# Altium schematic sheet MLP.SchDoc: Modulated Load Perturbation
size A4; ApprovedBy: LD Stanton; Author: LD Stanton; CompanyName: University of Cape Town; DrawnBy: Lawrence Stanton; Engineer: Lawrence Stanton; Organization: University of Cape Town; Address1: Department of Electrical Engineering; Address2: Rondebosch; Address3: Cape Town; Address4: South Africa 7701; DocumentNumber: 10; SheetNumber: 10; SheetTotal: 14
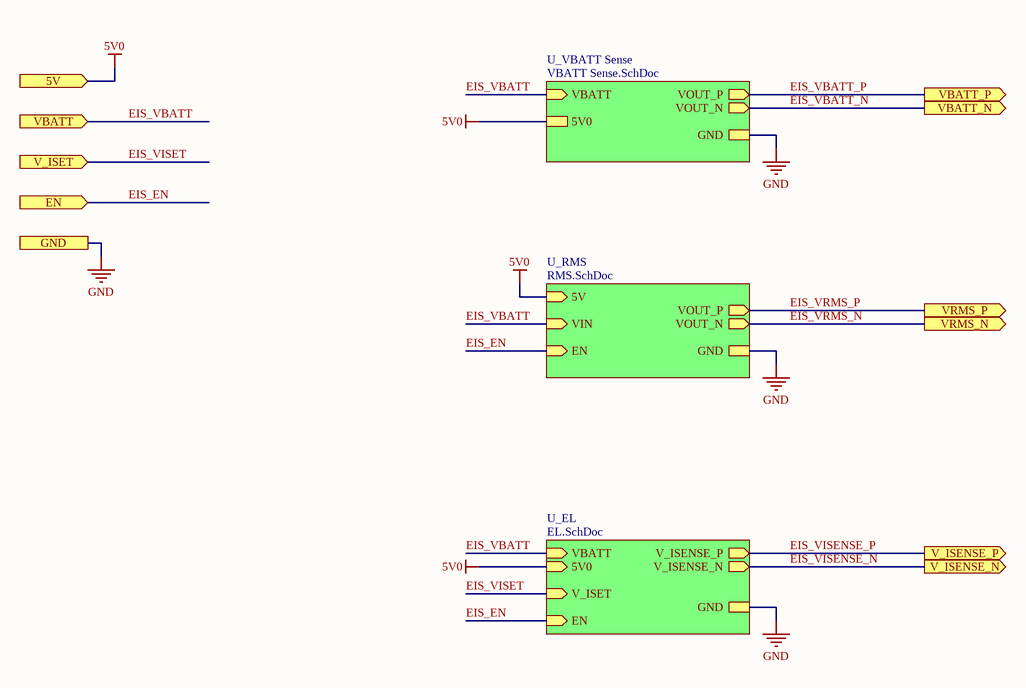
[diagram p0: MLP.SchDoc]

## Sub-sheets
U_EL = EL.SchDoc: GND, VBATT (in), V_ISET (in), 5V0 (in), V_ISENSE_P (out), EN (in), V_ISENSE_N (out)
U_RMS = RMS.SchDoc: 5V (in), GND, EN (in), VIN (in), VOUT_P (out), VOUT_N (out)
U_VBATT Sense = VBATT Sense.SchDoc: VBATT (in), VOUT_P (out), VOUT_N (out), GND, 5V0

## Ports
5V (in), EN (in), GND, V_ISENSE_N (out), V_ISENSE_P (out), V_ISET (in), VBATT (in), VBATT_N (out), VBATT_P (out), VRMS_N (out), VRMS_P (out)

## Nets
5V0: port 5V, sheet U_RMS/5V, sheet U_EL/5V0, sheet U_VBATT Sense/5V0
GND: port GND, sheet U_RMS/GND, sheet U_EL/GND, sheet U_VBATT Sense/GND
EIS_EN: port EN, sheet U_RMS/EN, sheet U_EL/EN
EIS_VBATT: port VBATT, sheet U_RMS/VIN, sheet U_EL/VBATT, sheet U_VBATT Sense/VBATT
EIS_VBATT_N: port VBATT_N, sheet U_VBATT Sense/VOUT_N
EIS_VBATT_P: port VBATT_P, sheet U_VBATT Sense/VOUT_P
EIS_VISENSE_N: port V_ISENSE_N, sheet U_EL/V_ISENSE_N
EIS_VISENSE_P: port V_ISENSE_P, sheet U_EL/V_ISENSE_P
EIS_VISET: port V_ISET, sheet U_EL/V_ISET
EIS_VRMS_N: port VRMS_N, sheet U_RMS/VOUT_N
EIS_VRMS_P: port VRMS_P, sheet U_RMS/VOUT_P

## Notes on the sheet
- Size:
- Date:
- A4
- Number:
- Time:
- Revision:
- Sheet
- of
- File:
- Author: